# Altium project WSN_Enviroment Monitoring System.PrjPcb
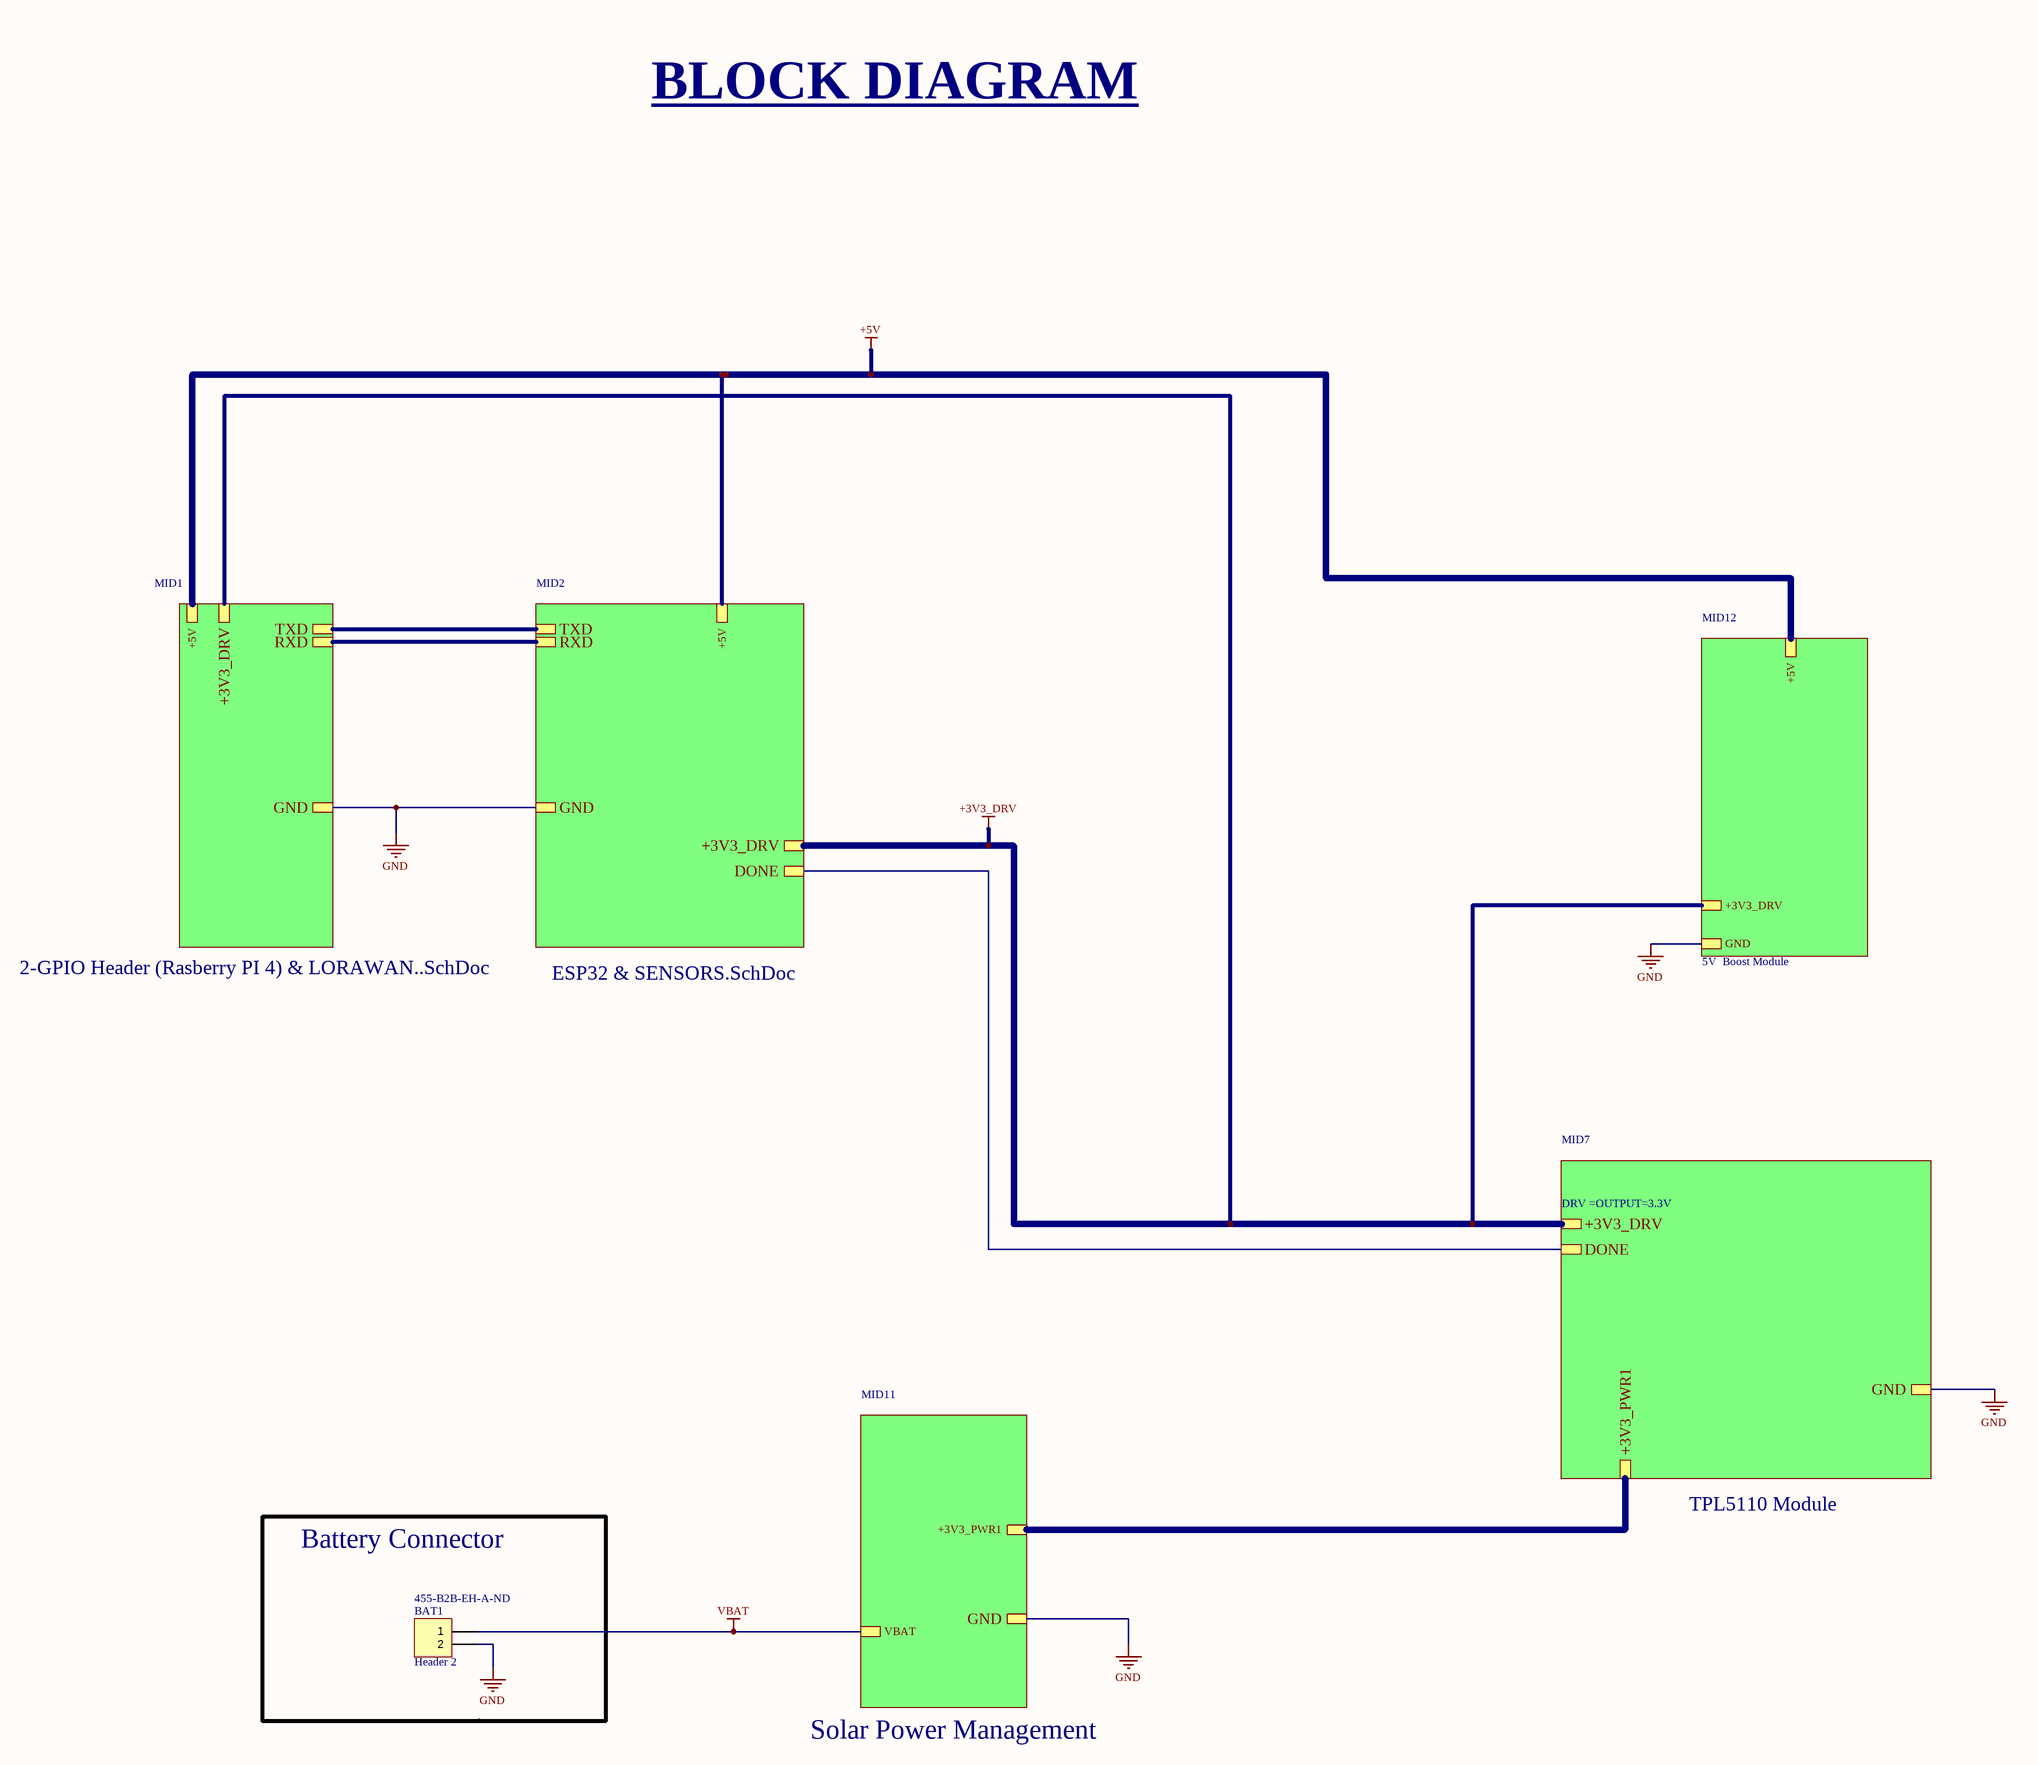
[diagram p0: TOP LEVEL.SchDoc]
4 sheets, 15 parts. Net scope: hierarchical (ports join the sheet entries above them; power ports are global).
Board file: WSN_Enviroment Monitoring system.PcbDoc
Sheets:
  TOP LEVEL.SchDoc
    MID7 = TPL5110 Module.SchDoc
    MID11 = Solar Power Management.SchDoc
    MID12 = 5V  Boost Module.SchDoc

## Sheet TOP LEVEL.SchDoc: BLOCK DIAGRAM
size 558 x 431 mm; Engineer: Awad Shibli; SheetNumber: 1; SheetTotal: 6

### Parts
BAT1  Header 2  Supplier Part Number 1: 455-B2B-EH-A-ND  [HDR1X2]

### Blocks framed on the sheet
Battery Connector: BAT1

### Sub-sheets
MID1 = 2-GPIO Header (Rasberry PI 4) & LORAWAN..SchDoc (file not in this document): TXD, RXD, +5V, GND, +3V3_DRV
MID2 = ESP32 & SENSORS.SchDoc (file not in this document): +3V3_DRV, DONE, RXD, TXD, GND, +5V
MID7 = TPL5110 Module: +3V3_DRV, DONE, +3V3_PWR1, GND
MID11 = Solar Power Management: VBAT, +3V3_PWR1, GND
MID12 = 5V  Boost Module: +5V, GND, +3V3_DRV

### Nets
+3V3_DRV: sheet MID1/+3V3_DRV, sheet MID2/+3V3_DRV, sheet MID7/+3V3_DRV, sheet MID12/+3V3_DRV
+5V: sheet MID1/+5V, sheet MID2/+5V, sheet MID12/+5V
GND: BAT1.2 ; sheet MID1/GND, sheet MID2/GND, sheet MID7/GND, sheet MID11/GND, sheet MID12/GND
VBAT: BAT1.1 ; sheet MID11/VBAT
NetC4_1: sheet MID7/+3V3_PWR1, sheet MID11/+3V3_PWR1
NetP6_5: sheet MID2/DONE, sheet MID7/DONE
(unnamed): sheet MID1/TXD, sheet MID2/TXD
(unnamed): sheet MID1/RXD, sheet MID2/RXD

### Notes on the sheet
- BLOCK DIAGRAM
- DRV =OUTPUT=3.3V
- DWG. NO.
- REV.
- SHT.
- REVISION
- DESCRIPTION
- DATE
- APPROVED
- THIS DOCUMENT AND THE DATA DISCLOSED HEREIN OR HEREWITH IS THE PROPERTY OF ALTIUM LIMITED AND MAY BE FREELY DISTRIBUTED IN WHOLE. NO RIGHTS ARE RESERVED OR EXPRESS OR IMPLIED WARANTEE GIVEN.
- ENG:
- DSN:
- APPROVALS
- PROJECT
- DOCUMENT REVISION:
- DESIGN ITEM:
- CHK:
- BOM:
- REFERENCE DOCUMENTS
- PROJECT REVISION:
- TITLE
- FAB DWG:
- PCB DWG:
- ASSY DWG:
- SCALE:
- SIZE
- C
- CAGE CODE
- FILE NAME
- DWG NO.
- SHEET
- OF
- REV

### Library data of the parts
BAT1 = Header 2: CONN HEADER EH TOP 2POS 2.5MM; Manufacturer: JST; Manufacturer Part Number: B2B-EH-A; Number of Positions: 2; Gender: Male; Pitch: 0.098inch; LatestRevisionDate: 17-Jul-2002; LatestRevisionNote: Re-released for DXP Platform.; Publisher: Altium Limited; Supplier 1: Digikey; RoHS: Yes; Category: Connectors; Stock 1: 251874; Pricing 1: 1=0.13, 10=0.099, 100=0.0756, 500=0.06274, 1000=0.05803, 5000=0.04865, 10000=0.04521 (USD); Mount: Through Hole; Color: Natural; Contact Plating: Tin,Lead; Housing Color: White; Contact Material: Brass; Housing Material: Nylon; Fastening Type: Detent; Packaging: Bulk; Package Quantity: 1000; Number of Rows: 1; Termination: Press-Fit; Number of Contacts: 2; Series: EH; Contact Type: Male Pin; Contact Mating Length: 0.13inch; Lead Free: Contains Lead; ComponentLink1URL: https://media.digikey.com/pdf/Data%20Sheets/JST%20PDFs/EH%20Series.pdf?src-supplier=Digikey; ComponentLink1Description: https://media.digikey.com/pdf/Data%20Sheets/JST%20PDFs/EH%20Series.pdf?src-supplier=Digikey

## Sheet TPL5110 Module.SchDoc: WSN_Enviroment Monitoring System
size A; DrawnBy: Awad Shibli; Engineer: Awad Shibli; SheetNumber: 3; SheetTotal: 6
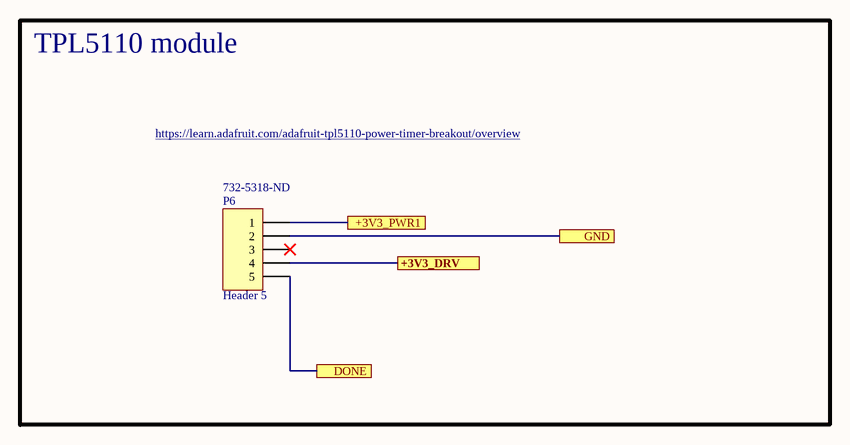
[diagram p1: TPL5110 Module.SchDoc]

### Parts
P6  Header 5  Supplier Part Number 1: 732-5318-ND  [HDR1X5]

### Blocks framed on the sheet
TPL5110 module: P6

### Ports
+3V3_DRV, +3V3_PWR1, DONE, GND

### Nets
+3V3_DRV: P6.4 ; port +3V3_DRV
GND: P6.2 ; port GND
NetC4_1: P6.1 ; port +3V3_PWR1
NetP6_5: P6.5 ; port DONE

Not connected (* = marked no-connect by the designer): P6 3*

### Notes on the sheet
- https://learn.adafruit.com/adafruit-tpl5110-power-timer-breakout/overview

### Library data of the parts
P6 = Header 5: THT Vertical Pin Header WR-PHD, Pitch 2.54 mm, Single Row, 5 pins; Manufacturer: Wurth Electronics; Manufacturer Part Number: 61300511121; Number of Positions: 5; Gender: Male; Contact Resistance: 20mR; Current Rating: 3A; Voltage Rating: 250V; Pitch: 0.1inch; LatestRevisionDate: 17-Jul-2002; LatestRevisionNote: Re-released for DXP Platform.; Publisher: Altium Limited; Supplier 1: Digikey; RoHS: Yes; Category: Headers and Wire Housings; Stock 1: 36429; Pricing 1: 1=0.26, 10=0.222, 25=0.1852, 50=0.155, 100=0.141, 1000=0.128 (USD); Mount: Through Hole; Contact Plating: Gold; Contact Material: Copper; Color: Black; Min Operating Temperature: -40°C; Max Operating Temperature: 105°C; Number of Rows: 1; Packaging: Bulk; Termination: Solder; Number of Contacts: 5; Series: WR-PHD; Contact Type: Male Pin; Orientation: 5495OrientationType; Operating Supply Voltage: 250V; Height: 8.89mm; Contact Mating Length: 0.236inch; Lead Free: Lead Free; RoHS Compliant: Yes; Reach SVHC Compliant: Unknown; ComponentLink1URL: http://www.farnell.com/cad/1737268.pdf?src-supplier=Element14; ComponentLink1Description: http://www.farnell.com/cad/1737268.pdf?src-supplier=Element14; ComponentLink2URL: https://datasheet.octopart.com/61300511121-W%C3%BCrth-Elektronik-datasheet-21154836.pdf?src-supplier=Element14; ComponentLink2Description: https://datasheet.octopart.com/61300511121-W%C3%BCrth-Elektronik-datasheet-21154836.pdf?src-supplier=Element14; ComponentLink3URL: https://katalog.we-online.de/em/datasheet/6130xx11121.pdf?src-supplier=Digikey; ComponentLink3Description: https://katalog.we-online.de/em/datasheet/6130xx11121.pdf?src-supplier=Digikey

## Sheet Solar Power Management.SchDoc: Solar Power Management
size 431 x 279 mm; ApprovedBy: Awad Shibli; CheckedBy: Awad Shibli; Author: Awad Shibli; DrawnBy: Awad Shibli; Engineer: Awad Shibli; SheetNumber: 2; SheetTotal: 6
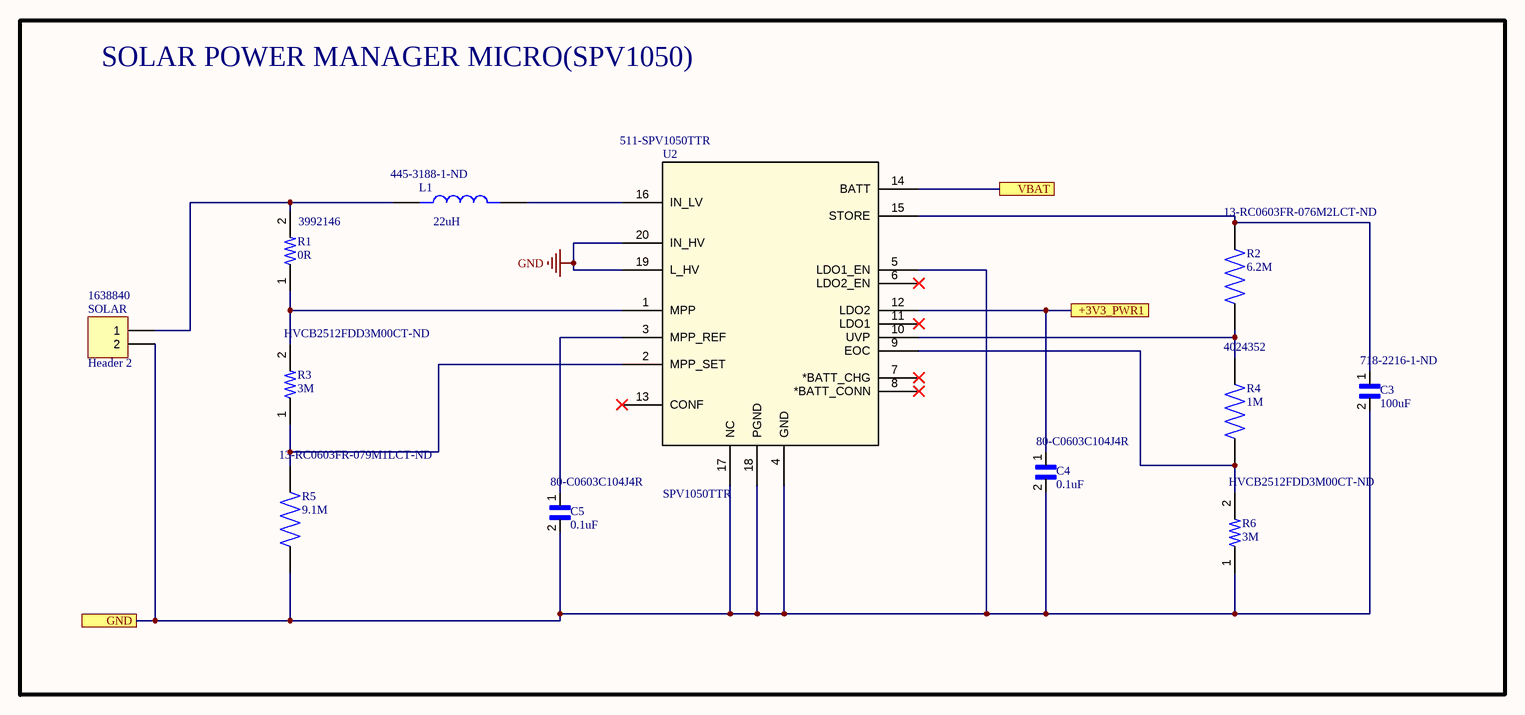
[diagram p2: Solar Power Management.SchDoc]

### Parts
C3  100uF  Supplier Part Number 1: 718-2216-1-ND  [C0603]
C4  0.1uF  Supplier Part Number 1: 80-C0603C104J4R  [C0603]
C5  0.1uF  Supplier Part Number 1: 80-C0603C104J4R  [C0603]
L1  22uH  Supplier Part Number 1: 445-3188-1-ND  [IND_VLCF4020T-220MR56]
R1  0R  Supplier Part Number 1: 3992146  [RESC1607X60N]
R2  6.2M  Supplier Part Number 1: 13-RC0603FR-076M2LCT-ND  [RESC1607X60N]
R3  3M  Supplier Part Number 1: HVCB2512FDD3M00CT-ND  [RESC1607X60N]
R4  1M  Supplier Part Number 1: 4024352  [RESC1607X60N]
R5  9.1M  Supplier Part Number 1: 13-RC0603FR-079M1LCT-ND  [RESC1607X60N]
R6  3M  Supplier Part Number 1: HVCB2512FDD3M00CT-ND  [RESC1607X60N]
SOLAR  Header 2  Supplier Part Number 1: 1638840  [HDR1X2]
U2  SPV1050TTR  Supplier Part Number 1: 511-SPV1050TTR  [QFN40P300X300X100-21N]

### Blocks framed on the sheet
SOLAR POWER MANAGER MICRO(SPV1050): C3-C5 L1 R1-R6 SOLAR U2

### Ports
+3V3_PWR1, GND, VBAT

### Nets
GND: C3.2 C4.2 C5.2 R5.1 R6.1 SOLAR.2 U2.4(GND) U2.5(LDO1_EN) U2.17(NC) U2.18(PGND) U2.19(L_HV) U2.20(IN_HV) ; port GND
VBAT: U2.14(BATT) ; port VBAT
NetC3_1: C3.1 R2.2 U2.15(STORE)
NetC4_1: C4.1 U2.12(LDO2) ; port +3V3_PWR1
NetC5_1: C5.1 U2.3(MPP_REF)
NetL1_1: L1.1 R1.2 SOLAR.1
NetL1_2: L1.2 U2.16(IN_LV)
NetR1_1: R1.1 R3.2 U2.1(MPP)
NetR2_1: R2.1 R4.2 U2.10(UVP)
NetR3_1: R3.1 R5.2 U2.2(MPP_SET)
NetR4_1: R4.1 R6.2 U2.9(EOC)

Not connected (* = marked no-connect by the designer): U2 6(LDO2_EN)* 7(*BATT_CHG)* 8(*BATT_CONN)* 11(LDO1)* 13(CONF)*

### Notes on the sheet
- DWG. NO.
- REV.
- SHT.
- THIS DOCUMENT AND THE DATA DISCLOSED HEREIN OR HEREWITH IS THE PROPERTY OF ALTIUM LIMITED AND MAY BE FREELY DISTRIBUTED IN WHOLE. NO RIGHTS ARE RESERVED OR EXPRESS OR IMPLIED WARANTEE GIVEN.
- REVISION
- DESCRIPTION
- DATE
- APPROVED
- ENG:
- APPROVALS
- PROJECT
- DSN:
- CHK:
- REFERENCE DOCUMENTS
- PROJECT REVISION:
- TITLE
- DOCUMENT REVISION:
- DESIGN ITEM:
- BOM:
- FAB DWG:
- PCB DWG:
- ASSY DWG:
- SCALE:
- SIZE
- B
- CAGE CODE
- FILE NAME
- DWG NO.
- SHEET
- OF
- REV

### Library data of the parts
C3 = C0603C104J4RACTU: Cap Tant Solid 100uF 4V M CASE 20% 1810-09 T/R; MF: Vishay Sprague; MP: 298W107X0004M2T; Package: 0603; Availability: Unavailable; Value: 100uF; Price: None; Supplier 1: Digikey; Manufacturer: Vishay Sprague; Manufacturer Part Number: 298W107X0004M2T; RoHS: Yes; Category: Tantalum Capacitors; Stock 1: 3940; Pricing 1: 1=1.93, 10=1.23, 50=0.9484, 100=0.8606, 500=0.71056, 1000=0.66366 (USD); Mount: Surface Mount; Case/Package: 0603; Case Code (Imperial): 0603; Case Code (Metric): 1608; Min Operating Temperature: -55°C; Max Operating Temperature: 125°C; Features: General Purpose; Packaging: Cut Tape; Capacitance: 100uF; Tolerance: 20%; Voltage Rating: 4V; Series: MICROTAN®, 298W; RoHS Compliant: Yes; ComponentLink1URL: http://www.vishay.com/docs/40169/typperfchar298dwtrl8.pdf?src-supplier=Digikey; ComponentLink1Description: http://www.vishay.com/docs/40169/typperfchar298dwtrl8.pdf?src-supplier=Digikey; ComponentLink2URL: http://www.vishay.com/docs/40065/298d298w.pdf?src-supplier=Digikey; ComponentLink2Description: http://www.vishay.com/docs/40065/298d298w.pdf?src-supplier=Digikey
C4 C5 = C0603C104J4RACTU: Capacitor; Ceramic; Cap; .100uF; Tol+5%; SMT; Vol-Rtg 16V; X7R; TR | KEMET C0603C104J4RACTU; Dielectric Material: 4241ConductorMaterial; Capacitance: 100nF; Tolerance: 5%; Dissipation Factor: 3.5%; Temperature Coefficient: 30ppm/°C; MF: KEMET; Package: 0603 Kemet; Availability: Unavailable; Value: *; MP: C0603C104J4RACTU; SnapEDA_Link: https://www.snapeda.com/parts/C0603C104J4RACTU/KEMET/view-part/550758/?ref=snap; Price: None; Supplier 1: Mouser; Manufacturer: KEMET; Manufacturer Part Number: C0603C104J4RACTU; RoHS: Yes; Category: Ceramic Capacitors; Stock 1: 240765; Pricing 1: 1=0.12, 10=0.035, 50=0.035, 100=0.018, 1000=0.013, 10000=0.006 (USD); Mount: Surface Mount; Case/Package: 0603; Number of Pins: 2; Case Code (Imperial): 0603; Case Code (Metric): 1608; Material: 4241ConductorMaterial; Min Operating Temperature: -55°C; Max Operating Temperature: 125°C; Packaging: Tape and Reel; Dielectric: X7R; Package Quantity: 4000; Voltage Rating: 16V; Termination: SMD/SMT; Voltage: 16V; Series: SMD Comm X7R; Construction: Flat; Voltage Rating (DC): 16V; Length: 1.6mm; Width: 0.8mm; Height: 0.8mm; Depth: 0.8mm; Lead Pitch: 0.7mm; Radiation Hardening: No; Reach SVHC Compliant: No; RoHS Compliant: Yes; Lead Free: 5697LeadFree; ComponentLink1URL: https://datasheet.ciiva.com/5999/1732731-5999390.pdf?src-supplier=Farnell; ComponentLink1Description: https://datasheet.ciiva.com/5999/1732731-5999390.pdf?src-supplier=Farnell; ComponentLink2URL: https://datasheet.ciiva.com/28645/1851736-28645613.pdf?src-supplier=Element14; ComponentLink2Description: https://datasheet.ciiva.com/28645/1851736-28645613.pdf?src-supplier=Element14; ComponentLink3URL: https://datasheet.ciiva.com/7823/kem-c1002-x7r-smd-7823982.pdf?src-supplier=Element14; ComponentLink3Description: https://datasheet.ciiva.com/7823/kem-c1002-x7r-smd-7823982.pdf?src-supplier=Element14
L1 = VLCF4020T-220MR56: Inductor Power Shielded Wirewound 22uH 20% 100KHz Ferrite 830mA 431mOhm DCR 1515 Blister T/R; MF: TDK; SnapEDA_Link: https://www.snapeda.com/parts/VLCF4020T-220MR56/TDK/view-part/?ref=snap; Package: NON STANDARD-2 TDK; Value: *; MP: VLCF4020T-220MR56; Check_prices: https://www.snapeda.com/parts/VLCF4020T-220MR56/TDK/view-part/?ref=eda; Supplier 1: Digikey; Manufacturer: TDK; Manufacturer Part Number: VLCF4020T-220MR56; RoHS: Yes; Category: Fixed Inductors; Stock 1: 9835; Pricing 1: 1=0.55, 10=0.372, 25=0.3292, 50=0.2862 (USD); ComponentLink1URL: https://datasheet.ciiva.com/15160/getdatasheetpartid-122360-15160436.pdf?src-supplier=Verical; ComponentLink1Description: https://datasheet.ciiva.com/15160/getdatasheetpartid-122360-15160436.pdf?src-supplier=Verical; ComponentLink2URL: https://datasheet.ciiva.com/11802/0900766b807a173d-11802556.pdf?src-supplier=Rs; ComponentLink2Description: https://datasheet.ciiva.com/11802/0900766b807a173d-11802556.pdf?src-supplier=Rs; ComponentLink3URL: https://datasheet.ciiva.com/8045/321084-8045781.pdf?src-supplier=Element14; ComponentLink3Description: https://datasheet.ciiva.com/8045/321084-8045781.pdf?src-supplier=Element14; ComponentLink4URL: https://datasheet.ciiva.com/30100/print-detail-pdf-phplangenpart-novlcf4020t-220mr56nreimp-unit-xmh-30100198.pdf?src-supplier=Onlinecomponents.com; ComponentLink4Description: https://datasheet.ciiva.com/30100/print-detail-pdf-phplangenpart-novlcf4020t-220mr56nreimp-unit-xmh-30100198.pdf?src-supplier=Onlinecomponents.com; ComponentLink5URL: https://datasheet.ciiva.com/15993/e531-vlcf4020-15993468.pdf?src-supplier=Onlinecomponents.com; ComponentLink5Description: https://datasheet.ciiva.com/15993/e531-vlcf4020-15993468.pdf?src-supplier=Onlinecomponents.com
R1 = RC0603FR-0710KL: GENERAL PURPOSE CHIP RESISTOR Metal Glaze/thick Film, 0.1W, 0ohm, Surface Mount, 0603; Manufacturer Part Number: RC0603JR-070RL; MF: Yageo; Resistance: 0mR; Tolerance: 1%; Power Rating: 100mW; Voltage Rating (DC): 50V; Temperature Coefficient: 200ppm/°C; Resistance Tolerance: 5%; Price: None; Check_prices: https://www.snapeda.com/parts/RC0603FR-0710KL/Yageo/view-part/105933/?ref=eda; Value: *; MP: RC0603FR-0710KL; Purchase-URL: https://pricing.snapeda.com/search/part/RC0603FR-0710KL/?ref=eda; Availability: Good; SnapEDA_Link: https://www.snapeda.com/parts/RC0603FR-0710KL/Yageo/view-part/105933/?ref=snap; Package: 0603 Yageo; Supplier 1: Future Electronics; Manufacturer: Yageo; RoHS: Yes; Category: Chip SMD Resistors; Stock 1: 10800000; Pricing 1: 5000=0.0013, 50000=0.0013, 150000=0.0012, 375000=0.0012, 1000000=0.0011 (USD); Case/Package: 0603; Number of Pins: 2; Contact Plating: Tin,Matte; Case Code (Imperial): 0603; Case Code (Metric): 1608; Size Code: 0603; Min Operating Temperature: -55°C; Max Operating Temperature: 155°C; Packaging: Tape and Reel; Resistor Type: Thick Film; Package Quantity: 5000; Voltage Rating: 50V; Termination: SMD/SMT; Features: Moisture Resistant; Series: RC; Max Power Dissipation: 100mW; Number of Terminations: 2; Construction: Rectangular; Technology: THICK FILM; Length: 1.6mm; Width: 0.8mm; Height: 0.45mm; Depth: 0.8mm; Reach SVHC Compliant: Unknown; Lead Free: 5697LeadFree; Military Standard: Not; RoHS Compliant: Yes; ComponentLink1URL: https://datasheet.ciiva.com/11808/pyu-r-int-6-11808700.pdf?src-supplier=Rs; ComponentLink1Description: https://datasheet.ciiva.com/11808/pyu-r-int-6-11808700.pdf?src-supplier=Rs; ComponentLink2URL: https://datasheet.ciiva.com/22747/443971-22747530.pdf?src-supplier=Element14; ComponentLink2Description: https://datasheet.ciiva.com/22747/443971-22747530.pdf?src-supplier=Element14; ComponentLink3URL: https://datasheet.ciiva.com/12555/rc0603-272842-12555254.pdf?src-supplier=Mouser; ComponentLink3Description: https://datasheet.ciiva.com/12555/rc0603-272842-12555254.pdf?src-supplier=Mouser; ComponentLink4URL: https://datasheet.ciiva.com/7746/1738695-7746421.pdf?src-supplier=Element14; ComponentLink4Description: https://datasheet.ciiva.com/7746/1738695-7746421.pdf?src-supplier=Element14
R2 = RC0603FR-076M2L: SMD Chip Resistor, 6.2 MOhm, ± 1%, 100 mW, 0603 [1608 Metric], Thick Film, General Purpose; Manufacturer: Yageo; Power Rating: 100mW; Resistance: 6.2MR; Voltage Rating: 50V; Temperature Coefficient: 100ppm/°C; Package: None; Price: None; Value: *; MP: RC0603FR-076M2L; Availability: Unavailable; Supplier 1: Digikey; Manufacturer Part Number: RC0603FR-076M2L; RoHS: Yes; Category: Chip SMD Resistors; Stock 1: 12242; Pricing 1: 1=0.1, 10=0.012, 50=0.0096, 100=0.0071, 500=0.00612, 1000=0.0051 (USD); Case/Package: 0603; Case Code (Imperial): 0603; Case Code (Metric): 1608; Min Operating Temperature: -55°C; Max Operating Temperature: 155°C; Packaging: Tape and Reel; Tolerance: 1%; Number of Terminations: 2; Termination: SMD/SMT; Max Power Dissipation: 100mW; Features: Moisture Resistant; Series: RC; Length: 0.063inch; Width: 0.8mm; Height: 0.022inch; RoHS Compliant: Yes; ComponentLink1URL: https://datasheet.ciiva.com/12576/rc0603-272842-12576220.pdf?src-supplier=Mouser; ComponentLink1Description: https://datasheet.ciiva.com/12576/rc0603-272842-12576220.pdf?src-supplier=Mouser
R3 R6 = RC0603FR-0710KL: Res Thick Film 2512 3M Ohm 1% 2W ±100ppm/°C Molded SMD Plastic T/R; Manufacturer: Stackpole Electronics; Manufacturer Part Number: HVCB2512FDD3M00; MF: Yageo; Resistance: 3MR; Price: None; Check_prices: https://www.snapeda.com/parts/RC0603FR-0710KL/Yageo/view-part/105933/?ref=eda; Value: *; MP: RC0603FR-0710KL; Purchase-URL: https://pricing.snapeda.com/search/part/RC0603FR-0710KL/?ref=eda; Availability: Good; SnapEDA_Link: https://www.snapeda.com/parts/RC0603FR-0710KL/Yageo/view-part/105933/?ref=snap; Package: 0603 Yageo; Supplier 1: Digikey; RoHS: Yes; Category: Chip SMD Resistors; Stock 1: 7905; Pricing 1: 1=4.36, 10=2.897, 50=2.5 (USD); Mount: Surface Mount; Case/Package: 2512; Case Code (Metric): 6432; Case Code (Imperial): 2512; Min Operating Temperature: -55°C; Max Operating Temperature: 150°C; Packaging: Tape and Reel; Number of Terminations: 2; Tolerance: 1%; Max Power Dissipation: 2W; Temperature Coefficient: 100ppm/°C; Series: HVC; Features: Moisture Resistant; RoHS Compliant: Yes; ComponentLink1URL: https://www.seielect.com/catalog/SEI-Packaging.pdf?src-supplier=Digikey; ComponentLink1Description: https://www.seielect.com/catalog/SEI-Packaging.pdf?src-supplier=Digikey; ComponentLink2URL: https://www.seielect.com/catalog/SEI-HVC.pdf?src-supplier=Digikey; ComponentLink2Description: https://www.seielect.com/catalog/SEI-HVC.pdf?src-supplier=Digikey
R4 = RC0603FR-076M2L: Thick film chip resistor smd; 0603; 1MR; 5%; 0.1W; ; operating temperature: -55°C~125°C; MF: YAGEO; MP: RC0603JR-071ML; Voltage Rating (DC): 50V; Temperature Coefficient: 100ppm/°C; Power Rating: 100mW; Package: None; Price: None; Value: 1M; Availability: Unavailable; Supplier 1: Future Electronics; Manufacturer: Yageo; Manufacturer Part Number: RC0603JR-071ML; RoHS: Yes; Category: Chip SMD Resistors; Stock 1: 1175000; Pricing 1: 5000=0.0018, 75000=0.0017, 200000=0.0017, 500000=0.0016, 1250000=0.0015 (USD); Case/Package: 0603; Number of Pins: 2; Contact Plating: Tin,Matte; Case Code (Imperial): 0603; Case Code (Metric): 1608; Size Code: 0603; Min Operating Temperature: -55°C; Max Operating Temperature: 155°C; Resistance: 1MR; Tolerance: 5%; Packaging: Tape and Reel; Resistor Type: Thick Film; Voltage Rating: 50V; Package Quantity: 5000; Termination: SMD/SMT; Features: Moisture Resistant; Series: RC; Max Power Dissipation: 100mW; Number of Terminations: 2; Resistance Tolerance: 5%; Voltage Rating (AC): 50V; Construction: Rectangular; Length: 1.6mm; Width: 0.8mm; Height: 0.45mm; Depth: 0.8mm; Reach SVHC Compliant: No; Lead Free: 5697LeadFree; RoHS Compliant: Yes; Military Standard: Not; ComponentLink1URL: https://datasheet.ciiva.com/46395/443971-46395067.pdf?src-supplier=Element14; ComponentLink1Description: https://datasheet.ciiva.com/46395/443971-46395067.pdf?src-supplier=Element14; ComponentLink2URL: https://datasheet.ciiva.com/12555/rc0603-272842-12555342.pdf?src-supplier=Mouser; ComponentLink2Description: https://datasheet.ciiva.com/12555/rc0603-272842-12555342.pdf?src-supplier=Mouser; ComponentLink3URL: https://datasheet.ciiva.com/7746/443971-7746463.pdf?src-supplier=Element14; ComponentLink3Description: https://datasheet.ciiva.com/7746/443971-7746463.pdf?src-supplier=Element14; ComponentLink4URL: https://datasheet.ciiva.com/8883/pyu-rc0603-51-rohs-l-4-8883053.pdf?src-supplier=Avnet; ComponentLink4Description: https://datasheet.ciiva.com/8883/pyu-rc0603-51-rohs-l-4-8883053.pdf?src-supplier=Avnet
R5 = RC0603FR-079M1L: Res Thick Film 0603 9.1M Ohm 1% 1/10W ±100ppm/°C Molded SMD Paper T/R; Manufacturer: Yageo; Resistance: 9.1MR; Power Rating: 100mW; Voltage Rating: 50V; Package: None; Price: None; Value: *; MP: RC0603FR-079M1L; Availability: Unavailable; Supplier 1: Digikey; Manufacturer Part Number: RC0603FR-079M1L; RoHS: Yes; Category: Chip SMD Resistors; Stock 1: 22431; Pricing 1: 1=0.1, 10=0.012, 50=0.0096, 100=0.0071, 500=0.00662, 1000=0.00612 (USD); Case/Package: 0603; Case Code (Imperial): 0603; Case Code (Metric): 1608; Contact Plating: Tin,Matte; Min Operating Temperature: -55°C; Max Operating Temperature: 155°C; Tolerance: 1%; Packaging: Tape and Reel; Number of Terminations: 2; Termination: SMD/SMT; Max Power Dissipation: 100mW; Temperature Coefficient: 100ppm/°C; Features: Moisture Resistant; Series: RC; Length: 0.063inch; Width: 0.8mm; Height: 0.022inch; RoHS Compliant: Yes; ComponentLink1URL: https://datasheet.ciiva.com/12560/rc0603-272842-12560525.pdf?src-supplier=Mouser; ComponentLink1Description: https://datasheet.ciiva.com/12560/rc0603-272842-12560525.pdf?src-supplier=Mouser
SOLAR = Header 2: CONNECTOR HEADER, XH SERIES, 2 POSITION, 2.50MM, Press-Fit Solder, Detent Lock, Natural; Manufacturer: JST; Manufacturer Part Number: B2B-XH-A(LF)(SN); Number of Contacts: 2; Contact Resistance: 20mR; Max Current Rating: 3A; Voltage Rating: 250V; Insulation Resistance: 1GR; Wire/Cable Gauge: 22AWG; Pitch: 2.5mm; LatestRevisionDate: 17-Jul-2002; LatestRevisionNote: Re-released for DXP Platform.; Publisher: Altium Limited; Supplier 1: Future Electronics; RoHS: Yes; Category: Headers and Wire Housings; Stock 1: 301686; Pricing 1: 1=0.0563, 750=0.0541, 2500=0.0518, 7500=0.0498, 25000=0.0458 (USD); Mount: Through Hole; Contact Material: Brass; Contact Plating: Tin,Lead,Copper; Color: Natural; Housing Color: White; Housing Material: Polyamide; Weight: 28.349523g; Min Operating Temperature: -25°C; Max Operating Temperature: 85°C; Orientation: Straight; Number of Rows: 1; Current Rating: 3A; Voltage Rating (AC): 250V; Packaging: Bulk; Number of Positions: 2; Termination: Solder; Fastening Type: Detent; Max Voltage Rating (AC): 250V; Max Voltage Rating (DC): 250V; Series: XH; Contact Type: Male Pin; Length: 7.4mm; Lead Pitch: 2.5mm; Depth: 5.75mm; Lead Free: 5697LeadFree; Reach SVHC Compliant: No; ComponentLink1URL: https://datasheet.ciiva.com/8052/5448-8052024.pdf?src-supplier=Element14; ComponentLink1Description: https://datasheet.ciiva.com/8052/5448-8052024.pdf?src-supplier=Element14
U2 = SPV1050TTR: Ultra low power energy harvester and battery charger with embedded MPPT and LDOs; Mfr_Name: STMicroelectronics; RefDes: RefDes; Type: Type; Supplier 1: Mouser; Manufacturer: STMicroelectronics; Manufacturer Part Number: SPV1050TTR; RoHS: Yes; Category: Battery Management; Stock 1: 17837; Pricing 1: 1=3.06, 10=2.67, 50=2.67, 100=2.38, 1000=1.85, 10000=1.64 (USD); ComponentLink1URL: http://www.mouser.com/ds/2/389/spv1050-974147.pdf?src-supplier=Mouser; ComponentLink1Description: http://www.mouser.com/ds/2/389/spv1050-974147.pdf?src-supplier=Mouser; ComponentLink2URL: http://www.farnell.com/datasheets/2291180.pdf?src-supplier=Farnell; ComponentLink2Description: http://www.farnell.com/datasheets/2291180.pdf?src-supplier=Farnell; ComponentLink3URL: http://www.st.com/web/en/resource/technical/document/datasheet/DM00100984.pdf?src-supplier=Avnet; ComponentLink3Description: http://www.st.com/web/en/resource/technical/document/datasheet/DM00100984.pdf?src-supplier=Avnet; ComponentLink4URL: http://www.st.com/content/ccc/resource/technical/document/datasheet/3e/91/0f/7c/32/3e/46/dd/DM00100984.pdf/files/DM00100984.pdf/jcr:content/translations/en.DM00100984.pdf?src-supplier=Digikey; ComponentLink4Description: http://www.st.com/content/ccc/resource/technical/document/datasheet/3e/91/0f/7c/32/3e/46/dd/DM00100984.pdf/files/DM00100984.pdf/jcr:content/translations/en.DM00100984.pdf?src-supplier=Digikey; ComponentLink5URL: https://datasheet.octopart.com/SPV1050TTR-STMicroelectronics-datasheet-82987336.pdf?src-supplier=SHENGYU+ELECTRONICS; ComponentLink5Description: https://datasheet.octopart.com/SPV1050TTR-STMicroelectronics-datasheet-82987336.pdf?src-supplier=SHENGYU+ELECTRONICS

## Sheet 5V  Boost Module.SchDoc: 5V  Boost Module
size 431 x 279 mm; DrawnBy: Awad Shibli; Engineer: Awad Shibli; SheetNumber: 4; SheetTotal: 6
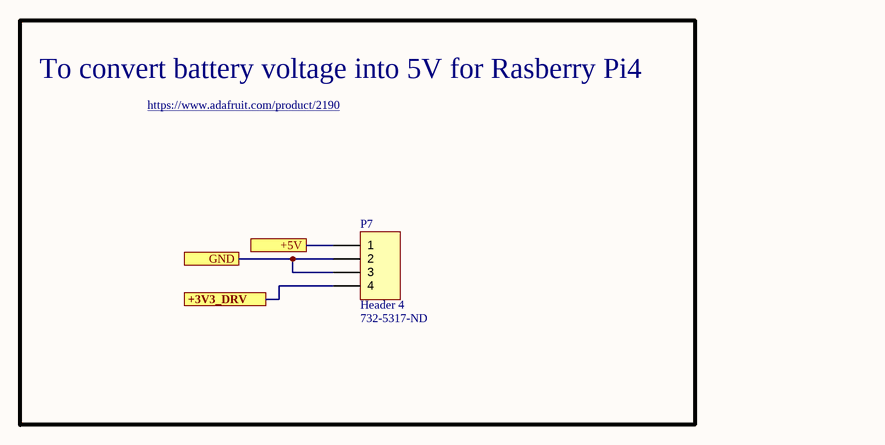
[diagram p3: 5V  Boost Module.SchDoc]

### Parts
P7  Header 4  Supplier Part Number 1: 732-5317-ND  [HDR1X4]

### Blocks framed on the sheet
To convert battery voltage into 5V for Rasberry Pi4: P7

### Ports
+3V3_DRV, +5V, GND

### Nets
+3V3_DRV: P7.4 ; port +3V3_DRV
+5V: P7.1 ; port +5V
GND: P7.2 P7.3 ; port GND

### Notes on the sheet
- https://www.adafruit.com/product/2190
- DWG. NO.
- REV.
- SHT.
- THIS DOCUMENT AND THE DATA DISCLOSED HEREIN OR HEREWITH IS THE PROPERTY OF ALTIUM LIMITED AND MAY BE FREELY DISTRIBUTED IN WHOLE. NO RIGHTS ARE RESERVED OR EXPRESS OR IMPLIED WARANTEE GIVEN.
- REVISION
- DESCRIPTION
- DATE
- APPROVED
- ENG:
- APPROVALS
- PROJECT
- DSN:
- CHK:
- REFERENCE DOCUMENTS
- PROJECT REVISION:
- TITLE
- DOCUMENT REVISION:
- DESIGN ITEM:
- BOM:
- FAB DWG:
- PCB DWG:
- ASSY DWG:
- SCALE:
- SIZE
- B
- CAGE CODE
- FILE NAME
- DWG NO.
- SHEET
- OF
- REV

### Library data of the parts
P7 = Header 4: THT Vertical Pin Header WR-PHD, Pitch 2.54 mm, Single Row, 4 pins; Manufacturer: Wurth Electronics; Manufacturer Part Number: 61300411121; Number of Positions: 4; Pitch: 0.1inch; LatestRevisionDate: 17-Jul-2002; LatestRevisionNote: Re-released for DXP Platform.; Publisher: Altium Limited; Supplier 1: Digikey; RoHS: Yes; Category: Headers and Wire Housings; Stock 1: 43988; Pricing 1: 1=0.19, 10=0.163, 25=0.1352, 50=0.113, 100=0.102, 1000=0.094 (USD); Mount: Through Hole; Contact Plating: Gold; Contact Material: Copper; Color: Black; Number of Rows: 1; Packaging: Bulk; Termination: Solder; Number of Contacts: 4; Series: WR-PHD; Contact Type: Male Pin; Contact Mating Length: 0.236inch; RoHS Compliant: Yes; Reach SVHC Compliant: Unknown; ComponentLink1URL: http://www.farnell.com/cad/1737268.pdf?src-supplier=Element14; ComponentLink1Description: http://www.farnell.com/cad/1737268.pdf?src-supplier=Element14; ComponentLink2URL: https://datasheet.octopart.com/61300411121-W%C3%BCrth-Elektronik-datasheet-21154836.pdf?src-supplier=Element14; ComponentLink2Description: https://datasheet.octopart.com/61300411121-W%C3%BCrth-Elektronik-datasheet-21154836.pdf?src-supplier=Element14; ComponentLink3URL: https://katalog.we-online.de/em/datasheet/6130xx11121.pdf?src-supplier=Digikey; ComponentLink3Description: https://katalog.we-online.de/em/datasheet/6130xx11121.pdf?src-supplier=Digikey

## Nets that join several sheets
+3V3_DRV: TPL5110 Module (P6.4), 5V  Boost Module (P7.4)
GND: TOP LEVEL (BAT1.2), TPL5110 Module (P6.2), Solar Power Management (12 pins), 5V  Boost Module (P7.2 P7.3)
VBAT: TOP LEVEL (BAT1.1), Solar Power Management (U2.14)
NetC4_1: TPL5110 Module (P6.1), Solar Power Management (C4.1 U2.12)